# Altium schematic sheet Power.SchDoc
size A4; SheetNumber: 4; SheetTotal: 4
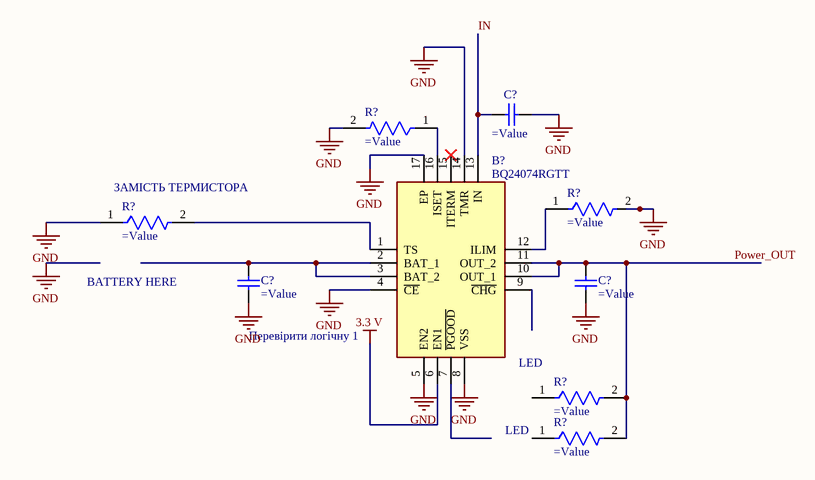
[diagram p0: Power.SchDoc]

## Parts
(Parts that share a designator on the sheet are numbered #1, #2 ... from top to bottom, then left to right.)
B?  BQ24074RGTT  [QFN50P300X300X100-17N-D]
C?#1  (no value)  [CAP_0603]
C?#2  (no value)  [CAP_0603]
C?#3  (no value)  [CAP_0603]
R?#1  (no value)  [Res_0603]
R?#2  (no value)  [Res_0603]
R?#3  (no value)  [Res_0603]
R?#4  (no value)  [Res_0603]
R?#5  (no value)  [Res_0603]

## Nets
3.3 V: B?.6(EN1)
GND: B?.4(~{CE}) B?.5(EN2) B?.8(VSS) B?.14(TMR) B?.17(EP) C?#1.2 C?#2.1 C?#3.1 R?#1.2 R?#2.2 R?#3.1
IN: B?.13(IN) C?#1.1
Power_OUT: B?.10(OUT_1) B?.11(OUT_2) C?#3.2 R?#4.2 R?#5.2
NetB?_1: B?.1(TS) R?#3.2
NetB?_2: B?.2(BAT_1) B?.3(BAT_2) C?#2.2
NetB?_12: B?.12(ILIM) R?#2.1
NetB?_16: B?.16(ISET) R?#1.1

Not connected (* = marked no-connect by the designer): B? 7(~{PGOOD}) 9(~{CHG}) 15(ITERM)*; R?#4 1; R?#5 1

## Notes on the sheet
- (near R?#3) ЗАМІСТЬ ТЕРМИСТОРА
- BATTERY HERE
- Перевірити логічну 1
- (near B?) LED
- (near R?#5) LED

## Library data of the parts
B? = BQ24074RGTT: USB-Friendly Li-Ion Battery Charger and Power-Path Management IC, 10.5V OVP; Manufacturer_Name: Texas Instruments; Geometry.Height: 1mm; Mouser Part Number: 595-BQ24074RGTT; Mouser Price/Stock: https://www.mouser.co.uk/ProductDetail/Texas-Instruments/BQ24074RGTT?qs=ZV%2Fxhq4oszp0gb4MsbpFYw%3D%3D; Manufacturer_Part_Number: BQ24074RGTT; Datasheet Link: http://www.ti.com/lit/gpn/bq24074
C?#1-C?#3 = CAP_0603: Manufacturer: Kemet; Part Number: C0603S153K3RACTU
R?#1-R?#5 = R_0603: 1.54kΩ ±1% 0.1W 0603 Thick Film Chip Resistor AEC-Q200 compliant; Resistance: 1.54kR; Temperature Coefficient: 200ppm/°C; Max Operating Temperature: 155°C; Radiation Hardening: No; Packaging: Tape and Reel; Case/Package: 0603; Min Operating Temperature: -55°C; Mount: Surface Mount; Resistor Type: Thick Film; Tolerance: 1%; RoHS Compliant: Yes